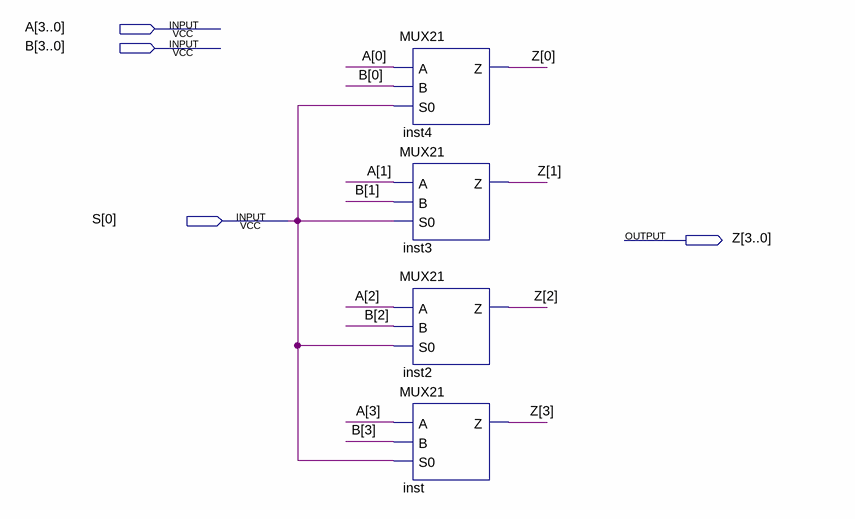
[diagram p0: schematic sheet]
// Quartus schematic MUX41.bdf as structural Verilog: 4 symbols, 4 pins
module MUX41 (
  input  [3:0] A,
  input  [3:0] B,
  input  [0:0] S,
  output [3:0] Z
);

  MUX21 inst4 (.A(A[0]), .B(B[0]), .S0(S[0]), .Z(Z[0]));
  MUX21 inst3 (.A(A[1]), .B(B[1]), .S0(S[0]), .Z(Z[1]));
  MUX21 inst2 (.A(A[2]), .B(B[2]), .S0(S[0]), .Z(Z[2]));
  MUX21 inst (.A(A[3]), .B(B[3]), .S0(S[0]), .Z(Z[3]));
endmodule
